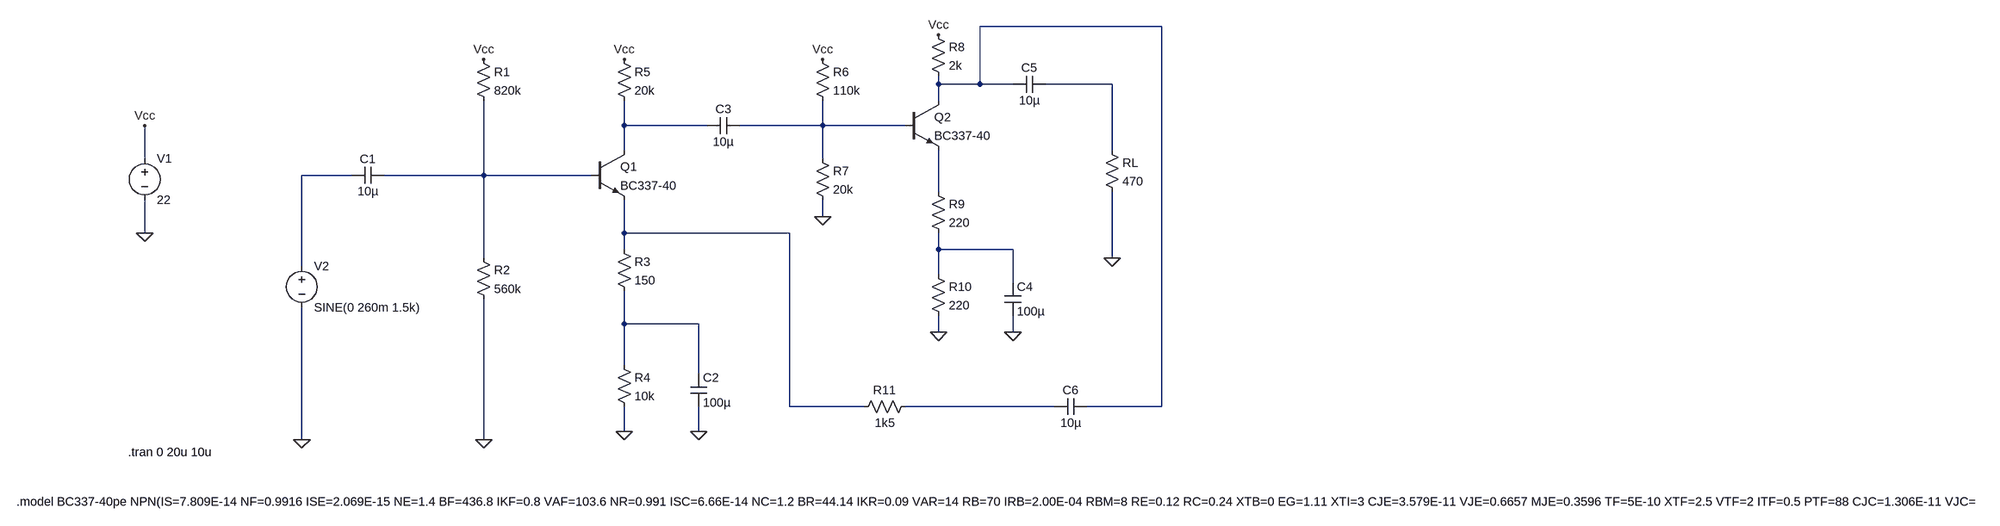
[diagram p0: schematic simulación_pedro.asc]
simulación_pedro.asc, the LTspice schematic file:
Version 4.1
SHEET 1 4680 952
WIRE 1392 16 1040 16
WIRE 960 128 960 112
WIRE 1040 128 1040 16
WIRE 1040 128 960 128
WIRE 1104 128 1040 128
WIRE 1296 128 1168 128
WIRE 960 160 960 128
WIRE 352 208 352 160
WIRE 512 208 352 208
WIRE 736 208 736 160
WIRE 736 208 576 208
WIRE 896 208 736 208
WIRE 352 256 352 208
WIRE 1296 256 1296 128
WIRE -576 272 -576 208
WIRE 736 272 736 208
WIRE -176 304 -272 304
WIRE 80 304 80 160
WIRE 80 304 -112 304
WIRE 288 304 80 304
WIRE 960 336 960 256
WIRE 736 384 736 352
WIRE -576 416 -576 352
WIRE 352 416 352 352
WIRE 672 416 352 416
WIRE 352 448 352 416
WIRE 960 448 960 416
WIRE 1104 448 960 448
WIRE 80 464 80 304
WIRE 1296 464 1296 336
WIRE -272 480 -272 304
WIRE 960 496 960 448
WIRE 1104 512 1104 448
WIRE 352 592 352 528
WIRE 496 592 352 592
WIRE 960 608 960 576
WIRE 1104 608 1104 576
WIRE 352 672 352 592
WIRE 496 688 496 592
WIRE 672 752 672 416
WIRE 816 752 672 752
WIRE 1184 752 896 752
WIRE 1392 752 1392 16
WIRE 1392 752 1248 752
WIRE 352 800 352 752
WIRE 496 800 496 752
WIRE -272 816 -272 560
WIRE 80 816 80 544
FLAG 960 608 0
FLAG 1104 608 0
FLAG 1296 464 0
FLAG 736 384 0
FLAG 496 800 0
FLAG 352 800 0
FLAG 80 816 0
FLAG -272 816 0
FLAG -576 416 0
FLAG -576 208 Vcc
FLAG 80 80 Vcc
FLAG 352 80 Vcc
FLAG 736 80 Vcc
FLAG 960 32 Vcc
SYMBOL res 64 64 R0
SYMATTR InstName R1
SYMATTR Value 820k
SYMBOL res 64 448 R0
SYMATTR InstName R2
SYMATTR Value 560k
SYMBOL cap -112 288 R90
WINDOW 0 0 32 VBottom 2
WINDOW 3 32 32 VTop 2
SYMATTR InstName C1
SYMATTR Value 10µ
SYMBOL res 336 432 R0
SYMATTR InstName R3
SYMATTR Value 150
SYMBOL res 336 656 R0
SYMATTR InstName R4
SYMATTR Value 10k
SYMBOL cap 480 688 R0
SYMATTR InstName C2
SYMATTR Value 100µ
SYMBOL res 336 64 R0
SYMATTR InstName R5
SYMATTR Value 20k
SYMBOL res 720 64 R0
SYMATTR InstName R6
SYMATTR Value 110k
SYMBOL cap 576 192 R90
WINDOW 0 0 32 VBottom 2
WINDOW 3 32 32 VTop 2
SYMATTR InstName C3
SYMATTR Value 10µ
SYMBOL npn 288 256 R0
SYMATTR InstName Q1
SYMATTR Value BC337-40
SYMBOL res 720 256 R0
SYMATTR InstName R7
SYMATTR Value 20k
SYMBOL npn 896 160 R0
SYMATTR InstName Q2
SYMATTR Value BC337-40
SYMBOL res 944 16 R0
SYMATTR InstName R8
SYMATTR Value 2k
SYMBOL res 944 320 R0
SYMATTR InstName R9
SYMATTR Value 220
SYMBOL res 944 480 R0
SYMATTR InstName R10
SYMATTR Value 220
SYMBOL cap 1088 512 R0
SYMATTR InstName C4
SYMATTR Value 100µ
SYMBOL cap 1168 112 R90
WINDOW 0 0 32 VBottom 2
WINDOW 3 32 32 VTop 2
SYMATTR InstName C5
SYMATTR Value 10µ
SYMBOL res 1280 240 R0
SYMATTR InstName RL
SYMATTR Value 470
SYMBOL voltage -576 256 R0
SYMATTR InstName V1
SYMATTR Value 22
SYMBOL cap 1248 736 R90
WINDOW 0 0 32 VBottom 2
WINDOW 3 32 32 VTop 2
SYMATTR InstName C6
SYMATTR Value 10µ
SYMBOL res 912 736 R90
WINDOW 0 0 56 VBottom 2
WINDOW 3 32 56 VTop 2
SYMATTR InstName R11
SYMATTR Value 1k5
SYMBOL voltage -272 464 R0
WINDOW 123 0 0 Left 0
WINDOW 39 0 0 Left 0
SYMATTR InstName V2
SYMATTR Value SINE(0 260m 1.5k)
TEXT -608 840 Left 2 !.tran 0 20u 10u
TEXT -824 936 Left 2 !.model BC337-40pe NPN(IS=7.809E-14 NF=0.9916 ISE=2.069E-15 NE=1.4 BF=436.8 IKF=0.8 VAF=103.6 NR=0.991 ISC=6.66E-14 NC=1.2 BR=44.14 IKR=0.09 VAR=14 RB=70 IRB=2.00E-04 RBM=8 RE=0.12 RC=0.24 XTB=0 EG=1.11 XTI=3 CJE=3.579E-11 VJE=0.6657 MJE=0.3596 TF=5E-10 XTF=2.5 VTF=2 ITF=0.5 PTF=88 CJC=1.306E-11 VJC=0.3647 MJC=0.3658 XCJC=0.455 TR=2.50E-08 CJS=0 VJS=0.75 MJS=0.333 FC=0.843 Vceo=45 Icrating=500m mfg=Philips)

The netlist it stands for:
* simulación_pedro.asc
R1 Vcc N006 820k
R2 N006 0 560k
C1 N006 N005 10µ
R3 N008 N010 150
R4 N010 0 10k
C2 N010 0 100µ
R5 Vcc N003 20k
R6 Vcc N004 110k
C3 N004 N003 10µ
Q1 N003 N006 N008 0 BC337-40
R7 N004 0 20k
Q2 N001 N004 N007 0 BC337-40
R8 Vcc N001 2k
R9 N007 N009 220
R10 N009 0 220
C4 N009 0 100µ
C5 N002 N001 10µ
RL N002 0 470
V1 Vcc 0 22
C6 N001 N011 10µ
R11 N011 N008 1k5
V2 N005 0 SINE(0 260m 1.5k)
.model NPN NPN
.model PNP PNP
.lib standard.bjt
.tran 0 20u 10u
.model BC337-40pe NPN(IS=7.809E-14 NF=0.9916 ISE=2.069E-15 NE=1.4 BF=436.8 IKF=0.8 VAF=103.6 NR=0.991 ISC=6.66E-14 NC=1.2 BR=44.14 IKR=0.09 VAR=14 RB=70 IRB=2.00E-04 RBM=8 RE=0.12 RC=0.24 XTB=0 EG=1.11 XTI=3 CJE=3.579E-11 VJE=0.6657 MJE=0.3596 TF=5E-10 XTF=2.5 VTF=2 ITF=0.5 PTF=88 CJC=1.306E-11 VJC=0.3647 MJC=0.3658 XCJC=0.455 TR=2.50E-08 CJS=0 VJS=0.75 MJS=0.333 FC=0.843 Vceo=45 Icrating=500m mfg=Philips)
.backanno
.end